# Altium project 24V-10A-Power-Board-v2.0.PrjPcb (part 14 of 17)
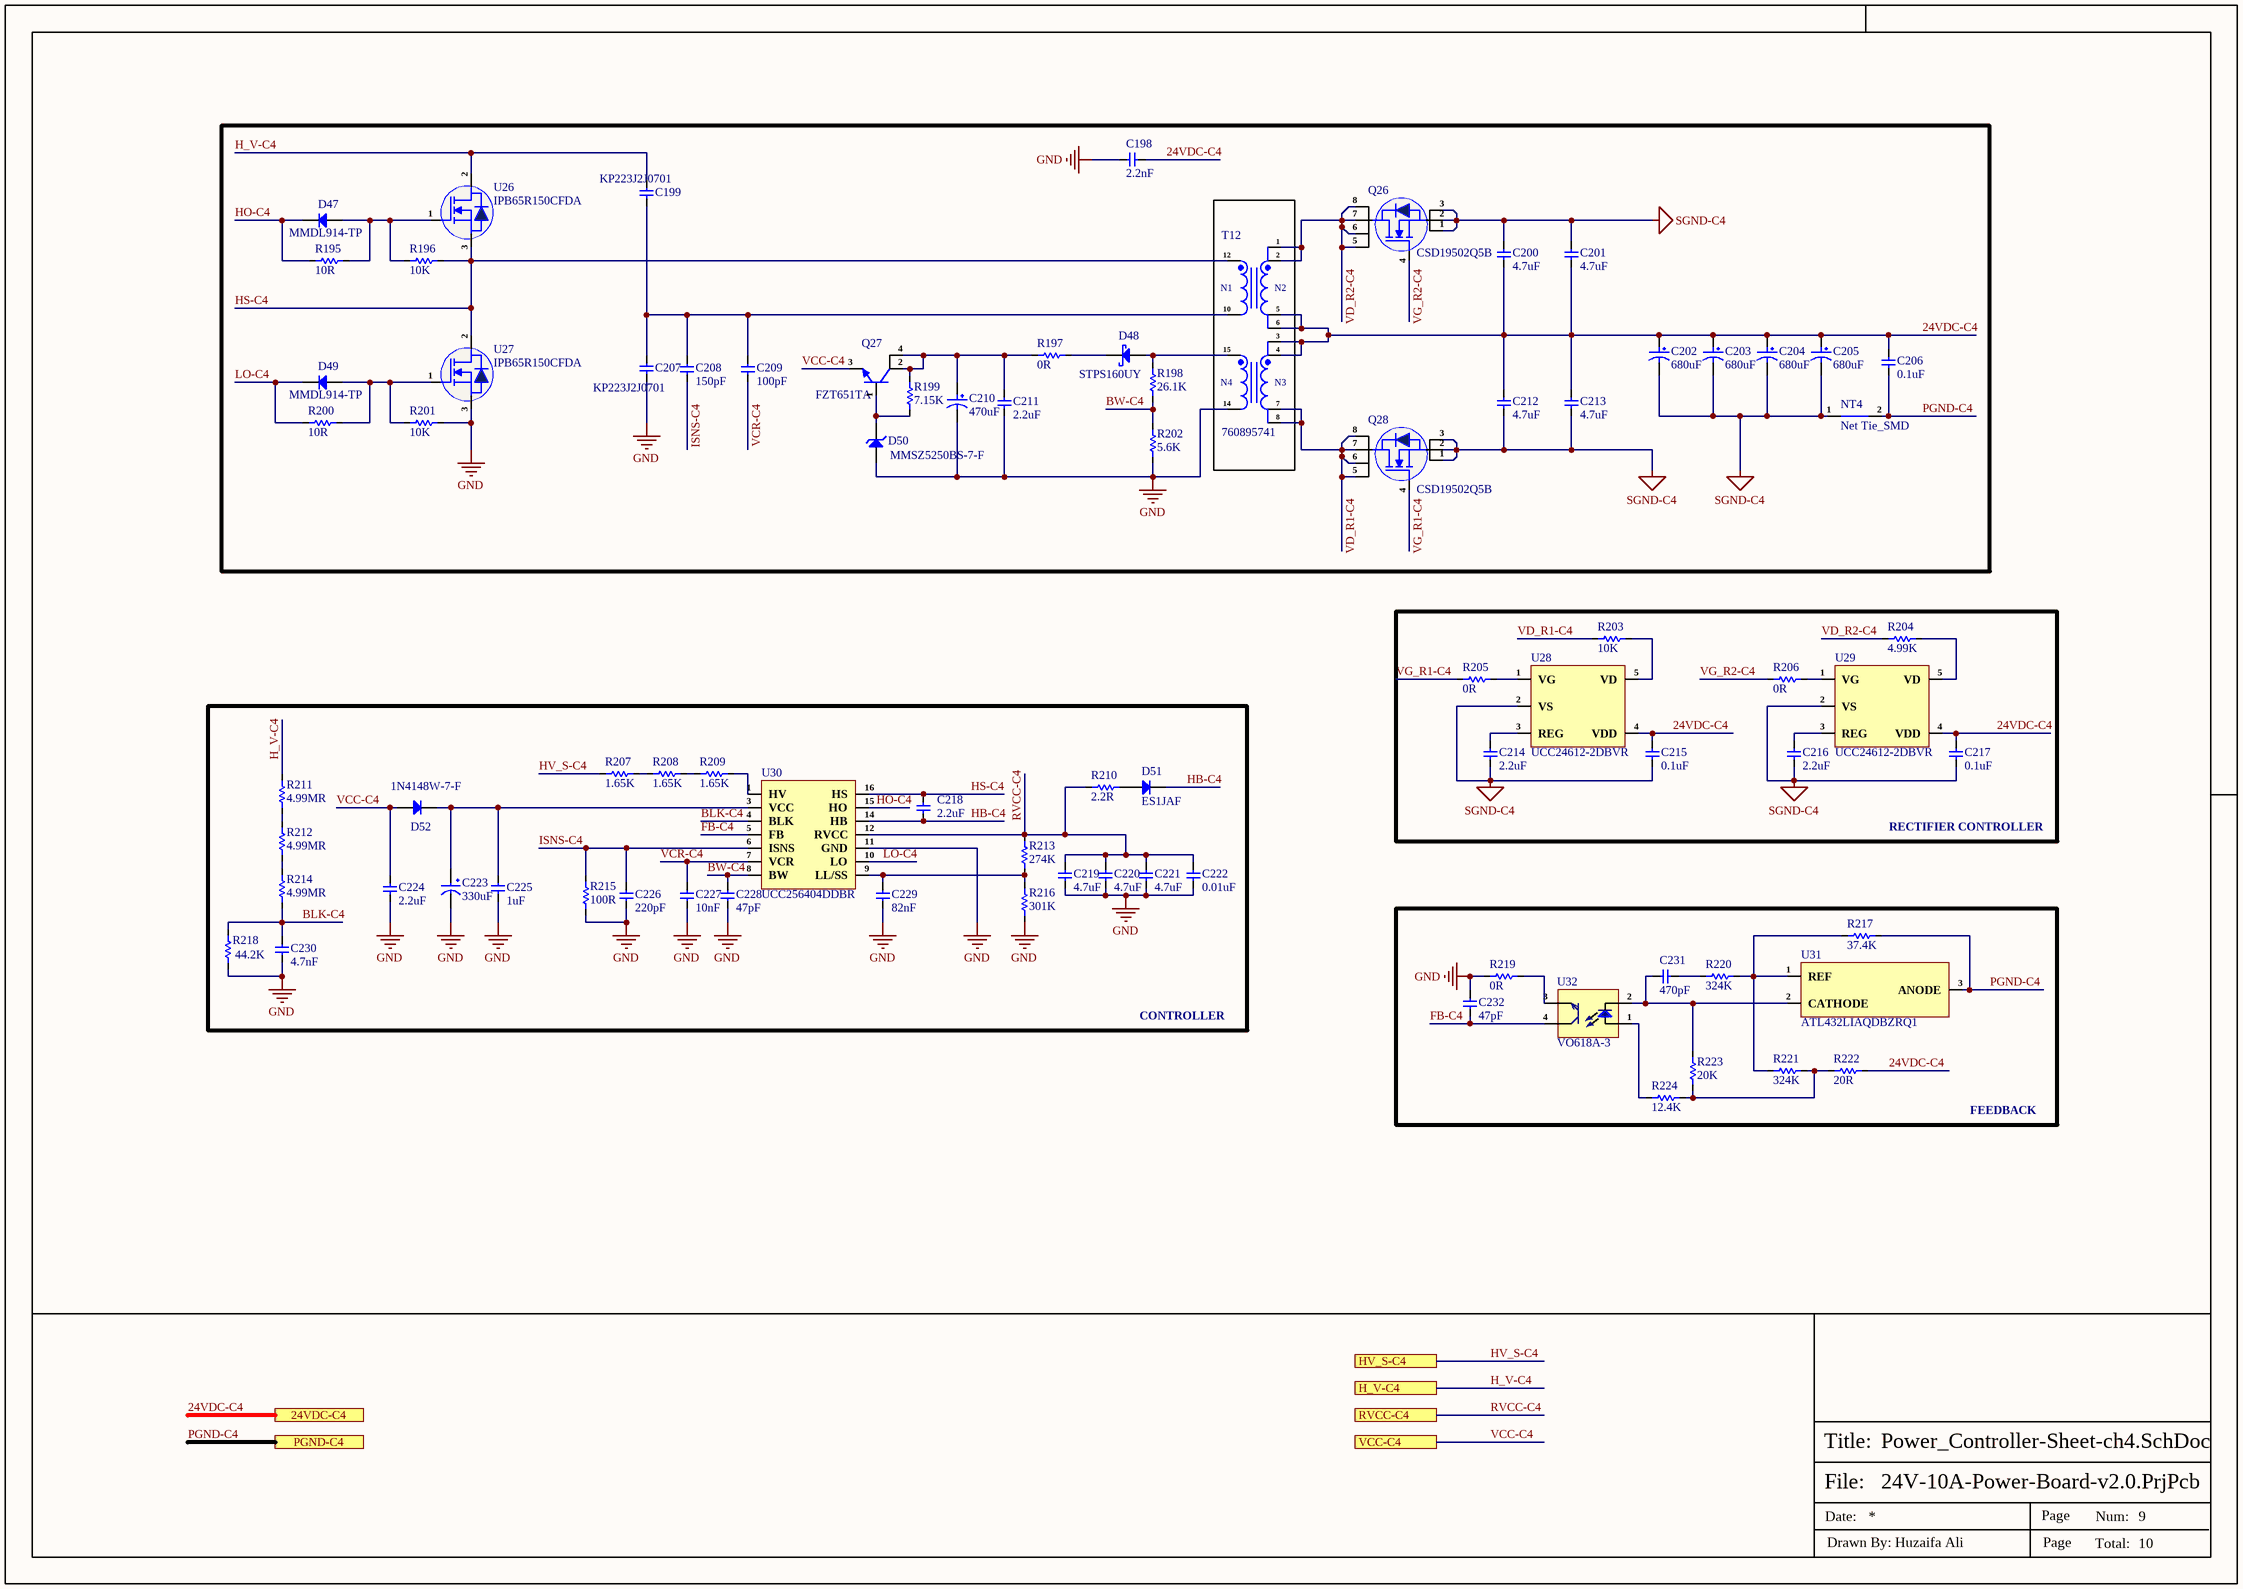
[diagram p22: Power_Controller-Sheet-ch4.SchDoc]

## Sheet Power_Controller-Sheet-ch4.SchDoc (continued)
### Library data of the parts
C198 = DE1E3RA222MA4BN01F: 2200 pF ±20% 250VAC Ceramic Capacitor E Radial, Disc; Manufacturer: Murata; Item Type: Capacitors; Supplier: Mouser; LCSC Part Number: C343981; Manufacturer Part Number: DE1E3RA222MA4BN01F; RoHS: Yes; Stock: 37677; Pricing: 1=0.42, 10=0.271, 50=0.271, 100=0.146, 1000=0.114, 10000=0.097 (USD); ComponentLink1URL: http://www.farnell.com/datasheets/2608335.pdf?src-supplier=Farnell; ComponentLink1Description: http://www.farnell.com/datasheets/2608335.pdf?src-supplier=Farnell; ComponentLink2URL: http://www.farnell.com/datasheets/2608335.pdf?src-supplier=Newark; ComponentLink2Description: http://www.farnell.com/datasheets/2608335.pdf?src-supplier=Newark; ComponentLink3URL: https://datasheet.octopart.com/DE1E3RA222MA4BN01F-Murata-datasheet-166166226.pdf?src-supplier=TME; ComponentLink3Description: https://datasheet.octopart.com/DE1E3RA222MA4BN01F-Murata-datasheet-166166226.pdf?src-supplier=TME
C199 C207 = KP223J2J0701: 22nF -40℃~+100℃ ±5% 630V Plugin,P=7.5mm Polypropylene Film Capacitors (CBB) ROHS; Manufacturer: KYET; Manufacturer Part Number: KP223J2J0701; Package: Plugin,P=7.5mm; LCSC Part Number: C390073; Item Type: Capacitor; ComponentLink1Description: LCSC; ComponentLink1URL: https://www.lcsc.com/product-detail/Polypropylene-Film-Capacitors-CBB_KYET-KP223J2J0701_C390073.html
C200 C201 C212 C213 = UMK316AB7475KL-T: CAP CER 4.7UF 50V X7R 1206; Manufacturer: Taiyo Yuden; Item Type: Capacitor; Tolerance: 10%; Supplier: Digikey; LCSC Part Number: C92853; Manufacturer Part Number: UMK316AB7475KL-T; RoHS: Yes; Stock: 392550; Pricing: 1=0.3, 10=0.198, 50=0.146, 100=0.1189, 500=0.09386, 1000=0.07925 (USD); Mounting Technology: Surface Mount; Case/Package: 1206; Pins: 2; Case Code (Metric): 3216; Case Code (Imperial): 1206; Min Operating Temperature: -55°C; Max Operating Temperature: 125°C; Value: 4.7uF; Voltage Rating: 50V; Packaging: Tape and Reel; Package Quantity: 2000; Voltage Rating (DC): 50V; Dielectric: X7R; Termination: SMD/SMT; Series: M; Construction: Flat; Length: 3.2mm; Width: 1.6mm; Height: 1.6mm; Depth: 1.6mm; Radiation Hardening: No; RoHS Compliant: Yes; Reach SVHC Compliant: Unknown; ComponentLink1URL: https://datasheet.ciiva.com/170/umk316ab7475kl-t-ss-170928.pdf?src-supplier=Digikey; ComponentLink1Description: https://datasheet.ciiva.com/170/umk316ab7475kl-t-ss-170928.pdf?src-supplier=Digikey; ComponentLink2URL: https://datasheet.ciiva.com/2990/umk316ab7475kl-t-ss-2990070.pdf?src-supplier=Avnet; ComponentLink2Description: https://datasheet.ciiva.com/2990/umk316ab7475kl-t-ss-2990070.pdf?src-supplier=Avnet; ComponentLink3URL: https://datasheet.ciiva.com/15922/1010umk316ab7475kl-t-15922628.pdf?src-supplier=Onlinecomponents.com; ComponentLink3Description: https://datasheet.ciiva.com/15922/1010umk316ab7475kl-t-15922628.pdf?src-supplier=Onlinecomponents.com; ComponentLink4URL: https://datasheet.ciiva.com/7975/1481447-7975911.pdf?src-supplier=Element14; ComponentLink4Description: https://datasheet.ciiva.com/7975/1481447-7975911.pdf?src-supplier=Element14; ComponentLink5URL: https://datasheet.ciiva.com/5413/mlcc-all-e-541559-5413006.pdf?src-supplier=Mouser; ComponentLink5Description: https://datasheet.ciiva.com/5413/mlcc-all-e-541559-5413006.pdf?src-supplier=Mouser
C202-C205 = EEU-FR1V681B: as C167-C170 on sheet Power_Controller-Sheet-ch3; Supplier: Digikey; LCSC Part Number: C178718; Manufacturer Part Number: EEU-FR1V681B; RoHS: Yes; Stock: 566; Pricing: 1=0.93, 10=0.674, 50=0.5894, 100=0.4803 (USD); Mounting Technology: Through Hole; Case/Package: Radial; Min Operating Temperature: -40°C; Max Operating Temperature: 105°C; Package Quantity: 500; Value: 680uF; Voltage Rating: 35V; Tolerance: 20%; Packaging: Tape and Reel; Voltage Rating (DC): 35V; ESR (Equivalent Series Resistance): 20mR; Termination: Radial; Series: FR; Features: General Purpose; Diameter: 10mm; Length: 20mm; Height: 20mm; Lead Pitch: 5mm; Height - Seated (Max): 0.866inch; Radiation Hardening: No; Reach SVHC Compliant: Yes; RoHS Compliant: Yes; ComponentLink1URL: https://datasheet.ciiva.com/11677/aba0000ce132-11677705.pdf?src-supplier=Avnet; ComponentLink1Description: https://datasheet.ciiva.com/11677/aba0000ce132-11677705.pdf?src-supplier=Avnet; ComponentLink2URL: https://datasheet.ciiva.com/15941/aba0000ce132-15941222.pdf?src-supplier=Onlinecomponents.com; ComponentLink2Description: https://datasheet.ciiva.com/15941/aba0000ce132-15941222.pdf?src-supplier=Onlinecomponents.com; ComponentLink3URL: https://datasheet.ciiva.com/43469/1653413-43469593.pdf?src-supplier=Farnell; ComponentLink3Description: https://datasheet.ciiva.com/43469/1653413-43469593.pdf?src-supplier=Farnell; ComponentLink4URL: https://datasheet.ciiva.com/46371/1653413-46371786.pdf?src-supplier=Element14; ComponentLink4Description: https://datasheet.ciiva.com/46371/1653413-46371786.pdf?src-supplier=Element14; ComponentLink5URL: https://datasheet.ciiva.com/29248/448590-da-01-en-alu-kondensator-fr-r-680-uf-35v-500st-29248054.pdf?src-supplier=Conrad; ComponentLink5Description: https://datasheet.ciiva.com/29248/448590-da-01-en-alu-kondensator-fr-r-680-uf-35v-500st-29248054.pdf?src-supplier=Conrad
C206 C215 C217 = CC1206KRX7R9BB104: CAP CER 0.1UF 50V X7R 1206; Manufacturer: Yageo; Item Type: Capacitor; Material: Ceramic; Value: 100nF; Tolerance: 10%; Insulation Resistance: 100GR; Supplier: Digikey; LCSC Part Number: 311-1179-1-ND; Manufacturer Part Number: CC1206KRX7R9BB104; RoHS: Yes; Stock: 520624; Pricing: 1=0.19, 10=0.128, 50=0.0764, 100=0.0601, 500=0.04436, 1000=0.03672 (USD); Mounting Technology: Surface Mount; Case/Package: 1206; Pins: 2; Case Code (Metric): 3216; Case Code (Imperial): 1206; Min Operating Temperature: -55°C; Max Operating Temperature: 125°C; Dielectric: X7R; Packaging: Tape and Reel; Voltage Rating: 50V; Termination: SMD/SMT; Voltage: 50V; Voltage Rating (DC): 50V; Series: CC; Length: 3.2mm; Height: 0.85mm; Depth: 1.6mm; Radiation Hardening: No; RoHS Compliant: Yes; Reach SVHC Compliant: Unknown; Lead Free: 5697LeadFree; Halogen Free: 5694HalogenFree; ComponentLink1URL: https://datasheet.ciiva.com/11786/0900766b80d84f1d-11786968.pdf?src-supplier=Rs; ComponentLink1Description: https://datasheet.ciiva.com/11786/0900766b80d84f1d-11786968.pdf?src-supplier=Rs; ComponentLink2URL: https://datasheet.ciiva.com/7978/1489800-7978230.pdf?src-supplier=Element14; ComponentLink2Description: https://datasheet.ciiva.com/7978/1489800-7978230.pdf?src-supplier=Element14; ComponentLink3URL: https://datasheet.ciiva.com/28450/1489800-28450892.pdf?src-supplier=Element14; ComponentLink3Description: https://datasheet.ciiva.com/28450/1489800-28450892.pdf?src-supplier=Element14; ComponentLink4URL: https://datasheet.ciiva.com/144/mlccorderingcode-144906.pdf?src-supplier=Digikey; ComponentLink4Description: https://datasheet.ciiva.com/144/mlccorderingcode-144906.pdf?src-supplier=Digikey; ComponentLink5URL: https://datasheet.ciiva.com/144/mlccorderingcode-144905.pdf?src-supplier=Digikey; ComponentLink5Description: https://datasheet.ciiva.com/144/mlccorderingcode-144905.pdf?src-supplier=Digikey; ComponentLink6URL: https://datasheet.ciiva.com/144/mlccorderingcode-144907.pdf?src-supplier=Digikey; ComponentLink6Description: https://datasheet.ciiva.com/144/mlccorderingcode-144907.pdf?src-supplier=Digikey; ComponentLink7URL: https://datasheet.ciiva.com/5425/upy-gp-np0-16v-to-50v-8-3714-5425561.pdf?src-supplier=Mouser; ComponentLink7Description: https://datasheet.ciiva.com/5425/upy-gp-np0-16v-to-50v-8-3714-5425561.pdf?src-supplier=Mouser; ComponentLink8URL: https://datasheet.ciiva.com/28363/1734573-28363672.pdf?src-supplier=Element14; ComponentLink8Description: https://datasheet.ciiva.com/28363/1734573-28363672.pdf?src-supplier=Element14; ComponentLink9URL: https://datasheet.ciiva.com/46385/1734573-46385063.pdf?src-supplier=Element14; ComponentLink9Description: https://datasheet.ciiva.com/46385/1734573-46385063.pdf?src-supplier=Element14; ComponentLink10URL: https://datasheet.ciiva.com/15189/getdatasheetpartid-251811-15189275.pdf?src-supplier=Verical; ComponentLink10Description: https://datasheet.ciiva.com/15189/getdatasheetpartid-251811-15189275.pdf?src-supplier=Verical
C208 = GRM31A5C2J151JW01D: CAP CER 150PF 630V C0G/NP0 1206; Manufacturer: Murata; Item Type: Capacitor; Supplier: Mouser; LCSC Part Number: C162445; Manufacturer Part Number: GRM31A5C2J151JW01D; RoHS: Yes; Stock: 4361; Pricing: 1=0.35, 10=0.194, 50=0.194, 100=0.12, 1000=0.1, 10000=0.08 (USD); ComponentLink1URL: https://datasheet.ciiva.com/138/partnumbering-e-01-138796.pdf?src-supplier=Digikey; ComponentLink1Description: https://datasheet.ciiva.com/138/partnumbering-e-01-138796.pdf?src-supplier=Digikey; ComponentLink2URL: https://datasheet.ciiva.com/138/partnumbering-e-01-138797.pdf?src-supplier=Digikey; ComponentLink2Description: https://datasheet.ciiva.com/138/partnumbering-e-01-138797.pdf?src-supplier=Digikey; ComponentLink3URL: https://datasheet.ciiva.com/138/partnumbering-e-01-138798.pdf?src-supplier=Digikey; ComponentLink3Description: https://datasheet.ciiva.com/138/partnumbering-e-01-138798.pdf?src-supplier=Digikey; ComponentLink4URL: https://datasheet.ciiva.com/13240/c02e-2905-13240518.pdf?src-supplier=Mouser; ComponentLink4Description: https://datasheet.ciiva.com/13240/c02e-2905-13240518.pdf?src-supplier=Mouser
C209 = GRM31A5C3A101JW01D: CAP CER 100PF 1KV 5% NP0 1206; Manufacturer: Murata; Item Type: Capacitor; Supplier: Future Electronics; LCSC Part Number: C162451; Manufacturer Part Number: GRM31A5C3A101JW01D; RoHS: Yes; Stock: 4000; Pricing: 4000=0.0742, 8000=0.0723, 12000=0.0712, 16000=0.0704, 20000=0.068 (USD); ComponentLink1URL: https://datasheet.ciiva.com/29535/partnumbering-e-01-29535608.pdf?src-supplier=Digikey; ComponentLink1Description: https://datasheet.ciiva.com/29535/partnumbering-e-01-29535608.pdf?src-supplier=Digikey; ComponentLink2URL: https://datasheet.ciiva.com/7829/1666664-7829029.pdf?src-supplier=Element14; ComponentLink2Description: https://datasheet.ciiva.com/7829/1666664-7829029.pdf?src-supplier=Element14
C210 = EEU-FR1V471B: CAP ALUM 470UF 20% 35V RADIAL; Manufacturer: Panasonic; Item Type: Capacitor; Leakage Current: 164.5uA; Supplier: Mouser; LCSC Part Number: C713403; Manufacturer Part Number: EEU-FR1V471B; RoHS: Yes; Stock: 21799; Pricing: 1=0.78, 10=0.461, 50=0.461, 100=0.375, 1000=0.263, 10000=0.23 (USD); Pins: 2NUMBER; Lead Free: 5697LeadFree; ComponentLink1URL: https://datasheet.ciiva.com/43469/1653413-43469590.pdf?src-supplier=Farnell; ComponentLink1Description: https://datasheet.ciiva.com/43469/1653413-43469590.pdf?src-supplier=Farnell; ComponentLink2URL: https://datasheet.ciiva.com/11678/aba0000ce132-11678063.pdf?src-supplier=Avnet; ComponentLink2Description: https://datasheet.ciiva.com/11678/aba0000ce132-11678063.pdf?src-supplier=Avnet; ComponentLink3URL: https://datasheet.ciiva.com/46371/1653413-46371772.pdf?src-supplier=Element14; ComponentLink3Description: https://datasheet.ciiva.com/46371/1653413-46371772.pdf?src-supplier=Element14; ComponentLink4URL: https://datasheet.ciiva.com/7805/1725490-7805503.pdf?src-supplier=Element14; ComponentLink4Description: https://datasheet.ciiva.com/7805/1725490-7805503.pdf?src-supplier=Element14; ComponentLink5URL: https://datasheet.ciiva.com/30252/9aba0000ce132-30252342.pdf?src-supplier=Onlinecomponents.com; ComponentLink5Description: https://datasheet.ciiva.com/30252/9aba0000ce132-30252342.pdf?src-supplier=Onlinecomponents.com; ComponentLink6URL: https://datasheet.ciiva.com/16387/aba0000ce132-16387061.pdf?src-supplier=Future+Electronics; ComponentLink6Description: https://datasheet.ciiva.com/16387/aba0000ce132-16387061.pdf?src-supplier=Future+Electronics; ComponentLink7URL: https://datasheet.ciiva.com/14602/70257620-14602201.pdf?src-supplier=Allied+Electronics; ComponentLink7Description: https://datasheet.ciiva.com/14602/70257620-14602201.pdf?src-supplier=Allied+Electronics; ComponentLink8URL: https://datasheet.ciiva.com/29247/448536-da-01-en-alu-kondensator-fr-r-470-uf-35v-500st-29247995.pdf?src-supplier=Conrad; ComponentLink8Description: https://datasheet.ciiva.com/29247/448536-da-01-en-alu-kondensator-fr-r-470-uf-35v-500st-29247995.pdf?src-supplier=Conrad
C211 = CC1206KKX5R9BB225: CAP CER 2.2UF 50V X5R 1206; Manufacturer: Yageo; Item Type: Capacitor; Material: 4241ConductorMaterial; Tolerance: 10%; Supplier: Digikey; LCSC Part Number: C577210; Manufacturer Part Number: CC1206KKX5R9BB225; RoHS: Yes; Stock: 4588; Pricing: 1=0.59, 10=0.395, 50=0.3144, 100=0.2597, 500=0.20286, 1000=0.17244 (USD); Mounting Technology: Surface Mount; Case/Package: 1206; Case Code (Metric): 3216; Case Code (Imperial): 1206; Weight: 0.000571oz; Min Operating Temperature: -55°C; Max Operating Temperature: 85°C; Packaging: Tape and Reel; Value: 2.2uF; Voltage Rating: 50V; Dielectric: X5R; Termination: SMD/SMT; Voltage Rating (DC): 50V; Package Quantity: 2000; Series: CC; Length: 0.126inch; Width: 0.063inch; Height: 1.45mm; Thickness: 0.071inch; Lead Free: Lead Free; Halogen Free: Halogen Free; RoHS Compliant: Yes; ComponentLink1URL: http://www.mouser.com/ds/2/447/Yageo_UPY-GP_NP0_16V-to-50V_9-358835.pdf?src-supplier=Mouser; ComponentLink1Description: http://www.mouser.com/ds/2/447/Yageo_UPY-GP_NP0_16V-to-50V_9-358835.pdf?src-supplier=Mouser; ComponentLink2URL: http://www.yageo.com/documents/recent/UPY-GPHC_X5R_4V-to-50V_25.pdf?src-supplier=Digikey; ComponentLink2Description: http://www.yageo.com/documents/recent/UPY-GPHC_X5R_4V-to-50V_25.pdf?src-supplier=Digikey
C214 C216 = CC0603KRX5R8BB225: CAP CER 2.2UF 25V X5R 0603; Manufacturer: Yageo; Tolerance: 10%; Item Type: Capacitor; Supplier 1: Digi-Key; Manufacturer Part Number: CC0603KRX5R8BB225; Stock 1: 687936; Pricing 1: 1=0.4, 10=0.276, 50=0.1932, 100=0.1656, 500=0.1242, 1000=0.10488 (USD); Mount: Surface Mount; Case/Package: 0603; Case Code (Metric): 1608; Case Code (Imperial): 0603; Weight: 7.1E-05oz; Min Operating Temperature: -55°C; Max Operating Temperature: 85°C; Packaging: Tape and Reel; Capacitance: 2.2uF; Dielectric: X5R; Voltage Rating: 25V; Termination: SMD/SMT; Resistor Type: Ceramic; Voltage Rating (DC): 25V; Package Quantity: 4000; Length: 1.6mm; Width: 0.031inch; Thickness: 0.037inch; Depth: 0.8mm; Radiation Hardening: No; Lead Free: Lead Free; Halogen Free: Halogen Free; RoHS Compliant: Yes; ComponentLink1URL: https://www.verical.com/server-webapp/html/getDatasheet?partID=782757&src-supplier=Verical; ComponentLink1Description: https://www.verical.com/server-webapp/html/getDatasheet?partID=782757&src-supplier=Verical; Supplier Part Number 1: 311-1786-1-ND; LCSC Part Number: C309478
C218 = CC1206KKX7R7BB225: CAP CER 2.2UF 16V X7R 1206; Manufacturer: Yageo; Item Type: Capacitors; Material: 4241ConductorMaterial; Supplier: Digikey; LCSC Part Number: C107183; Manufacturer Part Number: CC1206KKX7R7BB225; RoHS: Yes; Stock: 202610; Pricing: 1=0.22, 10=0.144, 50=0.1012, 100=0.0817, 500=0.06072, 1000=0.05312 (USD); ComponentLink1URL: https://datasheet.ciiva.com/11788/0900766b80d84f1d-11788402.pdf?src-supplier=Rs; ComponentLink1Description: https://datasheet.ciiva.com/11788/0900766b80d84f1d-11788402.pdf?src-supplier=Rs; ComponentLink2URL: https://datasheet.ciiva.com/11466/upy-gphc-x7r-6-3v-to-50v-8-11466572.pdf?src-supplier=Avnet; ComponentLink2Description: https://datasheet.ciiva.com/11466/upy-gphc-x7r-6-3v-to-50v-8-11466572.pdf?src-supplier=Avnet; ComponentLink3URL: https://datasheet.ciiva.com/5425/upy-gphc-x7r-6-3v-to-50v-8-12304-5425499.pdf?src-supplier=Mouser; ComponentLink3Description: https://datasheet.ciiva.com/5425/upy-gphc-x7r-6-3v-to-50v-8-12304-5425499.pdf?src-supplier=Mouser
C219-C221 = CC0603KRX5R7BB475: as C184-C186 on sheet Power_Controller-Sheet-ch3; Supplier 1: Digi-Key; Manufacturer Part Number: CC0603KRX5R7BB475; RoHS: Yes; Category: Ceramic Capacitors; Stock 1: 547703; Pricing 1: 1=0.20000, 10=0.13800, 50=0.08280, 100=0.06990, 500=0.04784, 1000=0.04233 (USD); Mount: Surface Mount; Case/Package: 0603; Case Code (Imperial): 0603; Case Code (Metric): 1608; Weight: 7.1E-05oz; Min Operating Temperature: -55°C; Max Operating Temperature: 85°C; Capacitance: 4.7uF; Voltage Rating: 16V; Voltage Rating (DC): 16V; Packaging: Tape and Reel; Dielectric: X5R; Termination: SMD/SMT; Resistor Type: Ceramic; Series: CC; Length: 1.6mm; Width: 0.8mm; Height: 0.8mm; Thickness: 0.037inch; Depth: 0.8mm; Lead Free: Lead Free; Halogen Free: Halogen Free; RoHS Compliant: Yes; ComponentLink1URL: http://www.mouser.com/ds/2/447/UPY-GPHC_X5R_4V-to-50V_25-1131599.pdf?src-supplier=Mouser; ComponentLink1Description: http://www.mouser.com/ds/2/447/UPY-GPHC_X5R_4V-to-50V_25-1131599.pdf?src-supplier=Mouser; ComponentLink2URL: http://www.yageo.com/documents/recent/UPY-GPHC_X5R_4V-to-50V_25.pdf?src-supplier=Digi-Key; ComponentLink2Description: http://www.yageo.com/documents/recent/UPY-GPHC_X5R_4V-to-50V_25.pdf?src-supplier=Digi-Key; Supplier Part Number 1: 311-1785-1-ND; LCSC Part Number: C277476
C222 = GRM1885C1H103JA01D: CAP CER 10000PF 50V C0G/NP0 0603; Manufacturer: Murata; Material: Ceramic; Capacitance: 10nF; Tolerance: 5%; Dielectric: C0G; Supplier 1: RSComponents; Manufacturer Part Number: GRM1885C1H103JA01D; RoHS: Yes; Category: Ceramic Capacitors; Stock 1: 80000; Pricing 1: 4000=0.03500, 8000=0.03200 (GBP); Mount: Surface Mount; Case/Package: 0603; Case Code (Metric): 1608; Case Code (Imperial): 0603; Min Operating Temperature: -55°C; Max Operating Temperature: 125°C; Packaging: Tape and Reel; Package Quantity: 4000; Voltage Rating: 50V; Voltage Rating (DC): 50V; Termination: SMD/SMT; Voltage: 50V; Series: GRM; Length: 1.6mm; Width: 0.8mm; Height: 0.8mm; Thickness: 0.035inch; Lead Pitch: 0.5mm; Depth: 0.8mm; REACH SVHC: No SVHC; Lead Free: Lead Free; RoHS Compliant: Yes; ComponentLink1URL: https://datasheet.ciiva.com/41860/partnumbering-e-01-41860759.pdf?src-supplier=Digi-Key; ComponentLink1Description: https://datasheet.ciiva.com/41860/partnumbering-e-01-41860759.pdf?src-supplier=Digi-Key; ComponentLink2URL: https://datasheet.ciiva.com/29537/partnumbering-e-01-29537910.pdf?src-supplier=Digi-Key; ComponentLink2Description: https://datasheet.ciiva.com/29537/partnumbering-e-01-29537910.pdf?src-supplier=Digi-Key; Supplier Part Number 1: 1449032
C223 = RC035M331LO8*14TH-2A1E: 330uF 35V ±20% 860mA@100kHz Plugin,D8xL14mm Aluminum Electrolytic Capacitors - Leaded ROHS; Manufacturer: BERYL Electronic Tech; Manufacturer Part Number: RC035M331LO8*14TH-2A1E; Package: Plugin,D8xL14mm; LCSC Part Number: C357626; Item Type: Capacitor; ComponentLink1Description: LCSC; ComponentLink1URL: https://www.lcsc.com/product-detail/Aluminum-Electrolytic-Capacitors-Leaded_BERYL-Electronic-Tech-RC035M331LO8-14TH-2A1E_C357626.html
C224 = GRM188R6YA225KA12D: CAP, 2.2µF, 35V, 10%, X5R, 0603; Manufacturer: Murata; Material: Ceramic; Item Type: Capacitor; Supplier 1: Digi-Key; Manufacturer Part Number: GRM188R6YA225KA12D; RoHS: Yes; Category: Ceramic Capacitors; Stock 1: 81665; Pricing 1: 1=0.21000, 10=0.14100, 50=0.08480, 100=0.07170, 500=0.04904, 1000=0.04338 (USD); Mount: Surface Mount; Case/Package: 0603; Case Code (Metric): 1608; Case Code (Imperial): 0603; Weight: 0.000222oz; Min Operating Temperature: -55°C; Max Operating Temperature: 85°C; Package Quantity: 4000; Packaging: Tape and Reel; Capacitance: 2.2uF; Tolerance: 10%; Voltage Rating: 35V; Dielectric: X5R; Voltage: 35V; Termination: SMD/SMT; Voltage Rating (DC): 35V; Series: GRM; Length: 1.6mm; Width: 0.8mm; Height: 0.8mm; Thickness: 0.035inch; Depth: 0.8mm; REACH SVHC: No SVHC; Lead Free: Lead Free; RoHS Compliant: Yes; ComponentLink1URL: https://datasheet.ciiva.com/14906/partnumbering-e-01-14906490.pdf?src-supplier=Digi-Key; ComponentLink1Description: https://datasheet.ciiva.com/14906/partnumbering-e-01-14906490.pdf?src-supplier=Digi-Key; ComponentLink2URL: https://datasheet.ciiva.com/14906/partnumbering-e-01-14906491.pdf?src-supplier=Digi-Key; ComponentLink2Description: https://datasheet.ciiva.com/14906/partnumbering-e-01-14906491.pdf?src-supplier=Digi-Key; ComponentLink3URL: https://datasheet.ciiva.com/14906/partnumbering-e-01-14906492.pdf?src-supplier=Digi-Key; ComponentLink3Description: https://datasheet.ciiva.com/14906/partnumbering-e-01-14906492.pdf?src-supplier=Digi-Key; Supplier Part Number 1: 490-7204-1-ND; LCSC Part Number: C86017
C225 = GRM31CR72A105KA01K: CAP CER 1UF 100V X7R 1206; Manufacturer: Murata; Tolerance: 10%; Supplier 1: Digi-Key; Manufacturer Part Number: GRM31CR72A105KA01K; RoHS: Yes; Category: Ceramic Capacitors; Stock 1: 11842; Pricing 1: 1=0.48000, 10=0.33000, 50=0.23100, 100=0.19800, 500=0.14850, 1000=0.12540, 2500=0.11880 (USD); Mount: Surface Mount; Case/Package: 1206; Case Code (Imperial): 1206; Case Code (Metric): 3216; Min Operating Temperature: -55°C; Max Operating Temperature: 125°C; Capacitance: 1uF; Voltage Rating: 100V; Voltage Rating (DC): 100V; Packaging: Tape and Reel; Package Quantity: 1; Dielectric: X7R; Termination: SMD/SMT; Series: GRM; Construction: Flat; Length: 3.2mm; Width: 1.6mm; Height: 1.6mm; Thickness: 0.071inch; Depth: 1.6mm; Radiation Hardening: No; RoHS Compliant: Yes; ComponentLink1URL: https://datasheet.ciiva.com/11616/product-11616604.pdf?src-supplier=Avnet; ComponentLink1Description: https://datasheet.ciiva.com/11616/product-11616604.pdf?src-supplier=Avnet; ComponentLink2URL: https://datasheet.ciiva.com/6264/partnumbering-e-01-6264397.pdf?src-supplier=Digi-Key; ComponentLink2Description: https://datasheet.ciiva.com/6264/partnumbering-e-01-6264397.pdf?src-supplier=Digi-Key; ComponentLink3URL: https://datasheet.ciiva.com/6264/partnumbering-e-01-6264398.pdf?src-supplier=Digi-Key; ComponentLink3Description: https://datasheet.ciiva.com/6264/partnumbering-e-01-6264398.pdf?src-supplier=Digi-Key; ComponentLink4URL: https://datasheet.ciiva.com/6264/partnumbering-e-01-6264399.pdf?src-supplier=Digi-Key; ComponentLink4Description: https://datasheet.ciiva.com/6264/partnumbering-e-01-6264399.pdf?src-supplier=Digi-Key; Supplier Part Number 1: 490-6523-1-ND; LCSC Part Number: C909823
C226 = CS1608X7R221K500NRB: 50V 220pF X7R ±10% 0603 Multilayer Ceramic Capacitors MLCC - SMD/SMT ROHS; Manufacturer: Samwha Capacitors; Manufacturer Part Number: CS1608X7R221K500NRB; Package: 0603; LCSC Part Number: C5255295; Item Type: Capacitor; ComponentLink1Description: LCSC; ComponentLink1URL: https://www.lcsc.com/product-detail/Multilayer-Ceramic-Capacitors-MLCC-SMD-SMT_Samwha-Capacitor-CS1608X7R221K500NRB_C5255295.html
C227 = 06031C103KAT2A: CAP CER 10000PF 100V X7R 0603; Manufacturer: Kyocera AVX; Item Type: Capacitors; Material: 4241ConductorMaterial; Tolerance: 10%; Insulation Resistance: 100GR; Dissipation Factor: 2.5%; Supplier: Avnet; LCSC Part Number: C2167322; Manufacturer Part Number: 06031C103KAT2A; RoHS: Yes; Stock: 512000; Pricing: 4000=0.05033 (USD); Mounting Technology: Surface Mount,PCB; Case/Package: 0603; Pins: 2; Case Code (Metric): 1608; Case Code (Imperial): 0603; Min Operating Temperature: -55°C; Max Operating Temperature: 125°C; Value: 10nF; Dielectric: X7R; Packaging: Tape and Reel; Voltage Rating (DC): 100V; Voltage: 100V; Voltage Rating: 100V; Package Quantity: 4000; Termination: SMD/SMT; Series: -; Construction: Flat; Voltage Rating (AC): 100V; Length: 1.6mm; Width: 0.006inch; Height: 0.9mm; Depth: 0.81mm; Thickness: 0.034inch; Reach SVHC Compliant: No; Lead Free: Lead Free; RoHS Compliant: Yes; ComponentLink1URL: https://datasheet.ciiva.com/11788/0900766b80dc2409-11788544.pdf?src-supplier=Rs; ComponentLink1Description: https://datasheet.ciiva.com/11788/0900766b80dc2409-11788544.pdf?src-supplier=Rs; ComponentLink2URL: https://datasheet.ciiva.com/1124/1679506-1124248.pdf?src-supplier=Element14; ComponentLink2Description: https://datasheet.ciiva.com/1124/1679506-1124248.pdf?src-supplier=Element14; ComponentLink3URL: https://datasheet.ciiva.com/152/cx7r-152476.pdf?src-supplier=Digikey; ComponentLink3Description: https://datasheet.ciiva.com/152/cx7r-152476.pdf?src-supplier=Digikey; ComponentLink4URL: https://datasheet.ciiva.com/2987/cx7r-2987736.pdf?src-supplier=Avnet; ComponentLink4Description: https://datasheet.ciiva.com/2987/cx7r-2987736.pdf?src-supplier=Avnet; ComponentLink5URL: https://datasheet.ciiva.com/1124/1679506-1124247.pdf?src-supplier=Element14; ComponentLink5Description: https://datasheet.ciiva.com/1124/1679506-1124247.pdf?src-supplier=Element14; ComponentLink6URL: https://datasheet.ciiva.com/7855/1679506-7855035.pdf?src-supplier=Element14; ComponentLink6Description: https://datasheet.ciiva.com/7855/1679506-7855035.pdf?src-supplier=Element14; ComponentLink7URL: https://datasheet.ciiva.com/152/cx7r-152475.pdf?src-supplier=Digikey; ComponentLink7Description: https://datasheet.ciiva.com/152/cx7r-152475.pdf?src-supplier=Digikey; ComponentLink8URL: https://datasheet.ciiva.com/152/cx7r-152477.pdf?src-supplier=Digikey; ComponentLink8Description: https://datasheet.ciiva.com/152/cx7r-152477.pdf?src-supplier=Digikey; ComponentLink9URL: https://datasheet.ciiva.com/5411/cx7r-5411278.pdf?src-supplier=Mouser; ComponentLink9Description: https://datasheet.ciiva.com/5411/cx7r-5411278.pdf?src-supplier=Mouser; ComponentLink10URL: https://datasheet.ciiva.com/14590/70001075-14590198.pdf?src-supplier=Allied+Electronics; ComponentLink10Description: https://datasheet.ciiva.com/14590/70001075-14590198.pdf?src-supplier=Allied+Electronics
C228 = GCM1555C1H470FA16D: CAP CER 47PF 50V C0G/NP0 0402; Manufacturer: Murata; Tolerance: 1%; Supplier 1: Digi-Key; Manufacturer Part Number: GCM1555C1H470FA16D; RoHS: No; Category: Ceramic Capacitors; Stock 1: 27098; Pricing 1: 1=0.11000, 10=0.07900, 50=0.04500, 100=0.03730, 500=0.02618, 1000=0.02168, 2500=0.02018, 5000=0.01846 (USD); Mount: Surface Mount; Case/Package: 0402; Case Code (Imperial): 0402; Case Code (Metric): 1005; Min Operating Temperature: -55°C; Max Operating Temperature: 125°C; Packaging: Tape and Reel; Capacitance: 47pF; Voltage Rating: 50V; Ratings: AEC-Q200; ComponentLink1URL: http://search.murata.co.jp/Ceramy/image/img/A01X/G101/ENG/GCM1555C1H470FA16-01.pdf?src-supplier=Digi-Key; ComponentLink1Description: http://search.murata.co.jp/Ceramy/image/img/A01X/G101/ENG/GCM1555C1H470FA16-01.pdf?src-supplier=Digi-Key; Supplier Part Number 1: 490-16445-1-ND; LCSC Part Number: C393684
C229 = CC0603KRX7R9BB823: CAP CER 0.082UF 50V X7R 0603; Manufacturer: Yageo; Tolerance: 10%; Supplier 1: Newark; Manufacturer Part Number: CC0603KRX7R9BB823; RoHS: Yes; Category: Ceramic Capacitors; Stock 1: 40000; Pricing 1: 1=0.01500, 4000=0.01400, 8000=0.01400 (USD); Mount: Surface Mount; Case/Package: 0603; Case Code (Imperial): 0603; Case Code (Metric): 1608; Weight: 7.1E-05oz; Min Operating Temperature: -55°C; Max Operating Temperature: 125°C; Packaging: Tape and Reel; Capacitance: 82nF; Voltage Rating (DC): 50V; Dielectric: X7R; Voltage Rating: 50V; Termination: SMD/SMT; Resistor Type: Ceramic; Series: CC; Length: 1.6mm; Width: 0.031inch; Thickness: 0.035inch; Depth: 0.8mm; Radiation Hardening: No; Lead Free: Lead Free; Halogen Free: Halogen Free; RoHS Compliant: Yes; ComponentLink1URL: https://datasheet.ciiva.com/13264/upy-gphc-x7r-6-3v-to-50v-8-12304-13264057.pdf?src-supplier=Mouser; ComponentLink1Description: https://datasheet.ciiva.com/13264/upy-gphc-x7r-6-3v-to-50v-8-12304-13264057.pdf?src-supplier=Mouser; Supplier Part Number 1: 69AH7269; LCSC Part Number: C107100
C230 = CC0603KRX7R0BB472: CAP CER 4700PF 100V X7R 0603; Manufacturer: Yageo; Item Type: Capacitor; Dielectric Material: 4241ConductorMaterial; Supplier: Digikey; LCSC Part Number: C115052; Manufacturer Part Number: CC0603KRX7R0BB472; RoHS: Yes; Stock: 67499; Pricing: 1=0.1, 10=0.05, 50=0.0288, 100=0.0223, 500=0.0168, 1000=0.01319 (USD); Voltage Rating (AC): 100V; Lead Free: 5697LeadFree; ComponentLink1URL: https://datasheet.ciiva.com/8033/1669968-8033781.pdf?src-supplier=Element14; ComponentLink1Description: https://datasheet.ciiva.com/8033/1669968-8033781.pdf?src-supplier=Element14
C231 = CC0603KPX7R9BB471: CAP CER 470PF 50V X7R 0603; Manufacturer: Yageo; Tolerance: 10%; Supplier 1: Digi-Key; Manufacturer Part Number: CC0603KPX7R9BB471; RoHS: Yes; Category: Ceramic Capacitors; Stock 1: 29788; Pricing 1: 1=0.10000, 10=0.04700, 50=0.02560, 100=0.02100, 500=0.01498, 1000=0.01176, 2500=0.01070, 5000=0.00984 (USD); Mount: Surface Mount; Case/Package: 0603; Case Code (Imperial): 0603; Case Code (Metric): 1608; Weight: 7.1E-05oz; Min Operating Temperature: -55°C; Max Operating Temperature: 125°C; Capacitance: 470pF; Dielectric: X7R; Voltage Rating (DC): 50V; Packaging: Tape and Reel; Termination: SMD/SMT; Resistor Type: Ceramic; Construction: Flat; Length: 1.6mm; Height: 0.8mm; Depth: 0.8mm; Radiation Hardening: No; Lead Free: Lead Free; Halogen Free: Halogen Free; RoHS Compliant: Yes; ComponentLink1URL: https://datasheet.ciiva.com/17436/upy-gphc-x7r-6-3v-to-50v-8-17436926.pdf?src-supplier=Avnet+Europe; ComponentLink1Description: https://datasheet.ciiva.com/17436/upy-gphc-x7r-6-3v-to-50v-8-17436926.pdf?src-supplier=Avnet+Europe; Supplier Part Number 1: 13-CC0603KPX7R9BB471CT-ND; LCSC Part Number: C2184946
C232 = CC0603FRNPO9BN470: CAP CER 47PF 50V NPO 0603; Manufacturer: Yageo; Item Type: Capacitor; Supplier: Digikey; LCSC Part Number: C519486; Manufacturer Part Number: CC0603FRNPO9BN470; RoHS: Yes; Stock: 37282; Pricing: 1=0.19, 10=0.126, 50=0.0756, 100=0.0594, 500=0.0439, 1000=0.03634 (USD); ComponentLink1URL: https://datasheet.ciiva.com/5425/upy-gp-np0-16v-to-50v-8-5425545.pdf?src-supplier=Mouser; ComponentLink1Description: https://datasheet.ciiva.com/5425/upy-gp-np0-16v-to-50v-8-5425545.pdf?src-supplier=Mouser; ComponentLink2URL: https://datasheet.ciiva.com/11586/upy-gp-np0-16v-to-50v-8-11586472.pdf?src-supplier=Avnet; ComponentLink2Description: https://datasheet.ciiva.com/11586/upy-gp-np0-16v-to-50v-8-11586472.pdf?src-supplier=Avnet
D47 D49 = MMDL914-TP: 100V 1V@10mA 4ns 200mA SOD-323 Switching Diodes ROHS; Manufacturer: MCC; Item Type: Diode; Supplier: Digikey; LCSC Part Number: C668970; Manufacturer Part Number: MMDL914-TP; RoHS: Yes; Stock: 172971; Pricing: 1=0.15, 10=0.108, 100=0.0585, 500=0.04594, 1000=0.03191 (USD); ComponentLink1URL: https://datasheet.ciiva.com/6367/mmdl914sod-323-6367364.pdf?src-supplier=Digikey; ComponentLink1Description: https://datasheet.ciiva.com/6367/mmdl914sod-323-6367364.pdf?src-supplier=Digikey; ComponentLink2URL: https://datasheet.ciiva.com/24097/mmdl914sod-323-24097719.pdf?src-supplier=Mouser; ComponentLink2Description: https://datasheet.ciiva.com/24097/mmdl914sod-323-24097719.pdf?src-supplier=Mouser; ComponentLink3URL: https://datasheet.ciiva.com/6367/mmdl914sod-323-6367366.pdf?src-supplier=Digikey; ComponentLink3Description: https://datasheet.ciiva.com/6367/mmdl914sod-323-6367366.pdf?src-supplier=Digikey; ComponentLink4URL: https://datasheet.ciiva.com/6367/mmdl914sod-323-6367368.pdf?src-supplier=Digikey; ComponentLink4Description: https://datasheet.ciiva.com/6367/mmdl914sod-323-6367368.pdf?src-supplier=Digikey
D48 = STPS160UY: DIODE SCHOTTKY 60V 1A SMB; Manufacturer: STMicroelectronics; Supplier: Mouser; LCSC Part Number: C5268303; Manufacturer Part Number: STPS160UY; RoHS: Yes; Item Type: Diode; Stock: 2181; Pricing: 1=0.46, 10=0.458, 50=0.458, 100=0.458, 1000=0.314, 10000=0.107 (USD); Mounting Technology: Surface Mount; Case/Package: SMB; Packaging: Tape and Reel; Package Quantity: 1; Average Rectified Current: 1A; Max Reverse Voltage (DC): 60V; Series: -; RoHS Compliant: Yes; ComponentLink1URL: https://datasheet.ciiva.com/6380/dm00058656-6380741.pdf?src-supplier=Digikey; ComponentLink1Description: https://datasheet.ciiva.com/6380/dm00058656-6380741.pdf?src-supplier=Digikey
D50 = MMSZ5250BS-7-F: 19V~21V 200mW 20V SOD-323-2 Zener Diodes ROHS; Item Type: Diode; Supplier: Future Electronics; LCSC Part Number: C508233; Manufacturer: Diodes; Manufacturer Part Number: MMSZ5250BS-7-F; RoHS: Yes; Stock: 3000; Pricing: 3000=0.0292, 9000=0.0281, 15000=0.0276, 60000=0.0263, 90000=0.0255 (USD); ComponentLink1URL: https://datasheet.ciiva.com/896/ds31038-896169.pdf?src-supplier=Digikey; ComponentLink1Description: https://datasheet.ciiva.com/896/ds31038-896169.pdf?src-supplier=Digikey; ComponentLink2URL: https://datasheet.ciiva.com/896/ds31038-896170.pdf?src-supplier=Digikey; ComponentLink2Description: https://datasheet.ciiva.com/896/ds31038-896170.pdf?src-supplier=Digikey; ComponentLink3URL: https://datasheet.ciiva.com/896/ds31038-896171.pdf?src-supplier=Digikey; ComponentLink3Description: https://datasheet.ciiva.com/896/ds31038-896171.pdf?src-supplier=Digikey; ComponentLink4URL: https://datasheet.ciiva.com/10640/ds31038-10640197.pdf?src-supplier=Avnet; ComponentLink4Description: https://datasheet.ciiva.com/10640/ds31038-10640197.pdf?src-supplier=Avnet
D51 = ES1JAF: DIODE GEN PURP 600V 1A DO214AD; Manufacturer: ON Semiconductor / Fairchild; Value: 15pF; Max Reverse Current: 1uA; Supplier: Digikey; LCSC Part Number: C896698; Manufacturer Part Number: ES1JAF; RoHS: Yes; Item Type: Diode; Stock: 35994; Pricing: 1=0.66, 10=0.443, 100=0.3026, 500=0.23836, 1000=0.21716, 2000=0.19913, 5000=0.17939 (USD); Forward Current: 1A; Reverse Voltage: 600V; Height: 1.1mm; ComponentLink1URL: http://www.farnell.com/datasheets/2572314.pdf?src-supplier=Farnell; ComponentLink1Description: http://www.farnell.com/datasheets/2572314.pdf?src-supplier=Farnell; ComponentLink2URL: http://www.farnell.com/datasheets/2572314.pdf?src-supplier=Newark; ComponentLink2Description: http://www.farnell.com/datasheets/2572314.pdf?src-supplier=Newark; ComponentLink3URL: http://www.farnell.com/datasheets/2572314.pdf?src-supplier=Element14; ComponentLink3Description: http://www.farnell.com/datasheets/2572314.pdf?src-supplier=Element14; ComponentLink4URL: https://www.onsemi.com/pub/Collateral/ES1JAF-D.PDF?src-supplier=Digikey; ComponentLink4Description: https://www.onsemi.com/pub/Collateral/ES1JAF-D.PDF?src-supplier=Digikey; ComponentLink5URL: https://www.fairchildsemi.com/datasheets/ES/ES1DAF.pdf?src-supplier=Digikey; ComponentLink5Description: https://www.fairchildsemi.com/datasheets/ES/ES1DAF.pdf?src-supplier=Digikey
D52 = 1N4148W-7-F: DIODE GEN PURP 100V 300MA SOD123; Manufacturer: Diodes; Forward Current: 150mA; Reverse Recovery Time: 4ns; Max Forward Surge Current (Ifsm): 2A; Element Configuration: Single; Max Reverse Current: 1uA; Forward Voltage: 1.25V; Power Dissipation: 400mW; Polarity: Standard; Voltage Rating (DC): 75V; Value: 2pF; Supplier 1: Future Electronics; Manufacturer Part Number: 1N4148W-7-F; RoHS: Yes; Category: Rectifier Diodes; Stock 1: 32931000; Pricing 1: 3000=0.01840, 12000=0.01760, 45000=0.01690, 120000=0.01640, 300000=0.01560 (USD); Mounting Technology: Surface Mount; Pins: 2; Weight: 0.000353oz; Contact Plating: Tin,Matte; Min Operating Temperature: -65°C; Max Operating Temperature: 150°C; Packaging: Tape and Reel; Max Repetitive Reverse Voltage (Vrrm): 100V; Peak Non-Repetitive Surge Current: 2A; Voltage: 100V; Max Surge Current: 2A; Package Quantity: 3000; Recovery Time: 4ns; Average Rectified Current: 300mA; Power Rating: 400mW; Current Rating: 150mA; Output Current: 150mA; Max Reverse Voltage (DC): 100V; Series: -; Reverse Recovery Time-Max: 4ns; Length: 2.85mm; Width: 1.7mm; Height: 1.25mm; Radiation Hardening: No; RoHS Compliant: Yes; Reach SVHC Compliant: Yes; Lead Free: Lead Free; ComponentLink1URL: https://datasheet.ciiva.com/1179/1915529-1179304.pdf?src-supplier=Element14; ComponentLink1Description: https://datasheet.ciiva.com/1179/1915529-1179304.pdf?src-supplier=Element14; ComponentLink2URL: https://datasheet.ciiva.com/22695/1915529-22695239.pdf?src-supplier=Element14; ComponentLink2Description: https://datasheet.ciiva.com/22695/1915529-22695239.pdf?src-supplier=Element14; ComponentLink3URL: https://datasheet.ciiva.com/8300/ds30086-8300392.pdf?src-supplier=Avnet; ComponentLink3Description: https://datasheet.ciiva.com/8300/ds30086-8300392.pdf?src-supplier=Avnet; ComponentLink4URL: https://datasheet.ciiva.com/15219/getdatasheetpartid-110030-15219548.pdf?src-supplier=Verical; ComponentLink4Description: https://datasheet.ciiva.com/15219/getdatasheetpartid-110030-15219548.pdf?src-supplier=Verical; ComponentLink5URL: https://datasheet.ciiva.com/8303/ds30086-8303197.pdf?src-supplier=Avnet; ComponentLink5Description: https://datasheet.ciiva.com/8303/ds30086-8303197.pdf?src-supplier=Avnet; ComponentLink6URL: https://datasheet.ciiva.com/911/ds30086-911735.pdf?src-supplier=Digi-Key; ComponentLink6Description: https://datasheet.ciiva.com/911/ds30086-911735.pdf?src-supplier=Digi-Key; ComponentLink7URL: https://datasheet.ciiva.com/911/ds30086-911736.pdf?src-supplier=Digi-Key; ComponentLink7Description: https://datasheet.ciiva.com/911/ds30086-911736.pdf?src-supplier=Digi-Key; ComponentLink8URL: https://datasheet.ciiva.com/911/ds30086-911734.pdf?src-supplier=Digi-Key; ComponentLink8Description: https://datasheet.ciiva.com/911/ds30086-911734.pdf?src-supplier=Digi-Key; ComponentLink9URL: https://datasheet.ciiva.com/4435/ds30086-4435128.pdf?src-supplier=Mouser; ComponentLink9Description: https://datasheet.ciiva.com/4435/ds30086-4435128.pdf?src-supplier=Mouser; Supplier Part Number 1: 7634694; LCSC Part Number: C83528; Item Type: Diode
NT4 = Net Tie_SMD: Net Tie SMD; Manufacturer Part Number: Net Tie; Item Type: Net Tie Pad
Q26 Q28 = CSD19502Q5B: MOSFET N-CH 80V 100A 8VSON; Manufacturer: Texas Instruments; Manufacturer Part Number: CSD19502Q5B; Package: 8-VSON-CLIP (5x6); LCSC Part Number: C2864118; Item Type: Mosfet; ComponentLink1Description: LCSC; ComponentLink1URL: https://jlcpcb.com/partdetail/TexasInstruments-CSD19502Q5B/C2864118
Q27 = FZT651TA: TRANS NPN 60V 3A SOT223-3; Manufacturer: Diodes Zetex; Item Type: BJTs; Max Power Dissipation: 2W; Number of Elements: 1; Frequency: 175MHz; hFE Min: 100; Collector Base Voltage (VCBO): 80V; Emitter Base Voltage (VEBO): 5V; Collector Emitter Saturation Voltage: 430mV; Collector-emitter Voltage-Max: 600mV; Supplier: Future Electronics; LCSC Part Number: C24098; Manufacturer Part Number: FZT651TA; RoHS: Yes; Stock: 670000; Pricing: 1000=0.265, 3000=0.255, 4000=0.25, 10000=0.245, 15000=0.24 (USD); Mounting Technology: Surface Mount; Case/Package: SOT-223; Pins: 4; Weight: 0.000282oz; Min Operating Temperature: -55°C; Max Operating Temperature: 150°C; Packaging: Tape and Reel; Package Quantity: 1; Collector Emitter Voltage (VCEO): 60V; Max Collector Current: 3A; Transition Frequency: 175MHz; Polarity: NPN; Continuous Collector Current: 3A; Collector Emitter Breakdown Voltage: 60V; Max Breakdown Voltage: 60V; Clock Frequency: 175MHz; Power Dissipation: 2W; Termination: SMD/SMT; Gain Bandwidth Product: 175MHz; Voltage Rating (DC): 60V; Current Rating: 3A; Current: 3A; Voltage: 60V; Series: -; Length: 6.7mm; Width: 3.7mm; Height: 1.65mm; Radiation Hardening: No; Reach SVHC Compliant: No; Lead Free: Lead Free; RoHS Compliant: Yes; ComponentLink1URL: https://datasheet.ciiva.com/5782/73067-5782650.pdf?src-supplier=Farnell; ComponentLink1Description: https://datasheet.ciiva.com/5782/73067-5782650.pdf?src-supplier=Farnell; ComponentLink2URL: https://datasheet.ciiva.com/8029/73067-8029643.pdf?src-supplier=Element14; ComponentLink2Description: https://datasheet.ciiva.com/8029/73067-8029643.pdf?src-supplier=Element14; ComponentLink3URL: https://datasheet.ciiva.com/4723/fzt651-4723319.pdf?src-supplier=Mouser; ComponentLink3Description: https://datasheet.ciiva.com/4723/fzt651-4723319.pdf?src-supplier=Mouser; ComponentLink4URL: https://datasheet.ciiva.com/975/fzt651-975544.pdf?src-supplier=Digikey; ComponentLink4Description: https://datasheet.ciiva.com/975/fzt651-975544.pdf?src-supplier=Digikey
R195 R200 = CRCW060310R0FKEA: RES SMD 10 OHM 1% 1/10W 0603; Manufacturer: Vishay; Item Type: Resistors; Power Rating: 100mW; Voltage Rating: 75V; Temperature Coefficient: 100ppm/°C; Supplier: Mouser; LCSC Part Number: C844919; Manufacturer Part Number: CRCW060310R0FKEA; RoHS: Yes; Stock: 648208; Pricing: 1=0.1, 10=0.017, 50=0.017, 100=0.01, 1000=0.008, 10000=0.005 (USD); Case/Package: 0603; Pins: 2; Weight: 7.1E-05oz; Case Code (Metric): 1608; Case Code (Imperial): 0603; Contact Plating: Tin; Min Operating Temperature: -55°C; Max Operating Temperature: 155°C; Value: 10R; Tolerance: 1%; Resistor Type: Thick Film; Packaging: Tape and Reel; Package Quantity: 10; Number of Terminations: 2; Termination: SMD/SMT; Max Power Dissipation: 100mW; Features: Automotive AEC-Q200; Series: CRCW; Resistance Tolerance: 1%; Technology: THICK FILM; Voltage Rating (DC): 75V; Construction: Rectangular; Length: 1.55mm; Width: 0.033inch; Height: 0.45mm; Depth: 0.85mm; RoHS Compliant: Yes; Reach SVHC Compliant: Unknown; Lead Free: 5697LeadFree; Military Standard: Not; ComponentLink1URL: https://datasheet.ciiva.com/11808/0900766b80d98afc-11808660.pdf?src-supplier=Rs; ComponentLink1Description: https://datasheet.ciiva.com/11808/0900766b80d98afc-11808660.pdf?src-supplier=Rs; ComponentLink2URL: https://datasheet.ciiva.com/26316/fld-crcw-e3-data-en-26316582.pdf?src-supplier=Distrelec; ComponentLink2Description: https://datasheet.ciiva.com/26316/fld-crcw-e3-data-en-26316582.pdf?src-supplier=Distrelec; ComponentLink3URL: https://datasheet.ciiva.com/2465/dcrcwe3-2465700.pdf?src-supplier=Digikey; ComponentLink3Description: https://datasheet.ciiva.com/2465/dcrcwe3-2465700.pdf?src-supplier=Digikey; ComponentLink4URL: https://datasheet.ciiva.com/16781/70201119-16781847.pdf?src-supplier=Allied+Electronics; ComponentLink4Description: https://datasheet.ciiva.com/16781/70201119-16781847.pdf?src-supplier=Allied+Electronics; ComponentLink5URL: https://datasheet.ciiva.com/22673/1697337-22673071.pdf?src-supplier=Element14; ComponentLink5Description: https://datasheet.ciiva.com/22673/1697337-22673071.pdf?src-supplier=Element14; ComponentLink6URL: https://datasheet.ciiva.com/2465/dcrcwe3-2465701.pdf?src-supplier=Digikey; ComponentLink6Description: https://datasheet.ciiva.com/2465/dcrcwe3-2465701.pdf?src-supplier=Digikey; ComponentLink7URL: https://datasheet.ciiva.com/2465/dcrcwe3-2465699.pdf?src-supplier=Digikey; ComponentLink7Description: https://datasheet.ciiva.com/2465/dcrcwe3-2465699.pdf?src-supplier=Digikey; ComponentLink8URL: https://datasheet.ciiva.com/5547/dcrcwe3-109170-5547342.pdf?src-supplier=Mouser; ComponentLink8Description: https://datasheet.ciiva.com/5547/dcrcwe3-109170-5547342.pdf?src-supplier=Mouser
R196 R201 = RC0805FR-7W10KL: RES 10K OHM 1% 1/4W 0805; Manufacturer: Yageo; Item Type: Resistor; Supplier: Avnet; Supplier Part Number: 49AK3472; Manufacturer Part Number: RC0805FR-7W10KL; RoHS: Yes; Category: Chip SMD Resistors; Stock: 5000; Pricing: 1=0.153, 25=0.038, 50=0.03, 100=0.02 (USD); LCSC Part Number: C723404
R197 = CRCW12060000Z0EA: RES SMD 0 OHM JUMPER 1/4W 1206; Manufacturer: Vishay; Item Type: Resistor; Value: 0mR; Power Rating: 250mW; Voltage Rating: 200V; Temperature Coefficient: 100ppm/°C; Tolerance: 1%; Supplier: Mouser; LCSC Part Number: C190124; Manufacturer Part Number: CRCW12060000Z0EA; RoHS: Yes; Stock: 852938; Pricing: 1=0.1, 10=0.039, 50=0.039, 100=0.018, 1000=0.013, 10000=0.007 (USD); Case/Package: 1206; Weight: 0.000353oz; Case Code (Imperial): 1206; Case Code (Metric): 3216; Contact Plating: Tin; Min Operating Temperature: -55°C; Max Operating Temperature: 155°C; Resistor Type: Thick Film; Packaging: Tape and Reel; Package Quantity: 5000; Termination: SMD/SMT; Features: Automotive AEC-Q200; Series: CRCW; Max Power Dissipation: 250mW; Number of Terminations: 2; Technology: THICK FILM; Voltage Rating (DC): 200V; Construction: Rectangular; Length: 3.2mm; Width: 1.6mm; Height: 0.55mm; Depth: 1.6mm; Ratings: AEC-Q200; Radiation Hardening: No; RoHS Compliant: Yes; Lead Free: 5697LeadFree; Military Standard: Not; Reach SVHC Compliant: Unknown; ComponentLink1URL: https://datasheet.ciiva.com/7841/1720486-7841862.pdf?src-supplier=Element14; ComponentLink1Description: https://datasheet.ciiva.com/7841/1720486-7841862.pdf?src-supplier=Element14
R198 = CRGH0603F26K1: RES SMD 26.1K OHM 1% 1/5W 0603; Manufacturer: TE Connectivity; Item Type: Resistor; Value: 26.1kR; Temperature Coefficient: 100ppm/°C; Max Power Dissipation: 200mW; Voltage Rating: 50V; Number of Resistors: 1; Supplier: Digikey; LCSC Part Number: C4086912; Manufacturer Part Number: CRGH0603F26K1; RoHS: Yes; Pricing: 20000=0.00865 (USD); Mounting Technology: Surface Mount; Case/Package: 0603; Case Code (Imperial): 0603; Case Code (Metric): 1608; Min Operating Temperature: -55°C; Max Operating Temperature: 155°C; Tolerance: 1%; Packaging: Tape and Reel; Number of Terminations: 2; Series: CRGH, Neohm; Power Rating: 200mW; Resistor Type: Thick Film,Power resistor; Termination: Solder; Length: 1.6mm; Width: 0.8mm; Height: 0.45mm; RoHS Compliant: Yes; ELV: Compliant; ComponentLink1URL: http://www.mouser.com/ds/2/418/NG_DS_1773204-1_C-717624.pdf?src-supplier=Mouser; ComponentLink1Description: http://www.mouser.com/ds/2/418/NG_DS_1773204-1_C-717624.pdf?src-supplier=Mouser; ComponentLink2URL: https://www.te.com/commerce/DocumentDelivery/DDEController?Action=srchrtrv&amp;DocNm=1773204-1&amp;DocType=DS&amp;DocLang=English&src-supplier=Digikey; ComponentLink2Description: https://www.te.com/commerce/DocumentDelivery/DDEController?Action=srchrtrv&amp;DocNm=1773204-1&amp;DocType=DS&amp;DocLang=English&src-supplier=Digikey
R199 = CRCW06037K15FKEA: RES SMD 7.15K OHM 1% 1/10W 0603; Manufacturer: Vishay; Item Type: Resistor; Supplier: Mouser; LCSC Part Number: C844382; Manufacturer Part Number: CRCW06037K15FKEA; RoHS: Yes; Stock: 18619; Pricing: 1=0.1, 10=0.019, 50=0.019, 100=0.009, 1000=0.007, 10000=0.004 (USD); Lead Free: 5697LeadFree; ComponentLink1URL: https://datasheet.ciiva.com/11810/0900766b80d98afc-11810198.pdf?src-supplier=Rs; ComponentLink1Description: https://datasheet.ciiva.com/11810/0900766b80d98afc-11810198.pdf?src-supplier=Rs; ComponentLink2URL: https://datasheet.ciiva.com/22707/1697337-22707757.pdf?src-supplier=Element14; ComponentLink2Description: https://datasheet.ciiva.com/22707/1697337-22707757.pdf?src-supplier=Element14; ComponentLink3URL: https://datasheet.ciiva.com/7679/1697337-7679142.pdf?src-supplier=Element14; ComponentLink3Description: https://datasheet.ciiva.com/7679/1697337-7679142.pdf?src-supplier=Element14; ComponentLink4URL: https://datasheet.ciiva.com/7679/1697337-7679143.pdf?src-supplier=Element14; ComponentLink4Description: https://datasheet.ciiva.com/7679/1697337-7679143.pdf?src-supplier=Element14; ComponentLink5URL: https://datasheet.ciiva.com/16397/dcrcwe3-16397317.pdf?src-supplier=Future+Electronics; ComponentLink5Description: https://datasheet.ciiva.com/16397/dcrcwe3-16397317.pdf?src-supplier=Future+Electronics; ComponentLink6URL: https://datasheet.ciiva.com/2466/dcrcwe3-2466245.pdf?src-supplier=Digikey; ComponentLink6Description: https://datasheet.ciiva.com/2466/dcrcwe3-2466245.pdf?src-supplier=Digikey; ComponentLink7URL: https://datasheet.ciiva.com/2466/dcrcwe3-2466246.pdf?src-supplier=Digikey; ComponentLink7Description: https://datasheet.ciiva.com/2466/dcrcwe3-2466246.pdf?src-supplier=Digikey; ComponentLink8URL: https://datasheet.ciiva.com/2466/dcrcwe3-2466247.pdf?src-supplier=Digikey; ComponentLink8Description: https://datasheet.ciiva.com/2466/dcrcwe3-2466247.pdf?src-supplier=Digikey; ComponentLink9URL: https://datasheet.ciiva.com/3257/dcrcwe3-3257899.pdf?src-supplier=Avnet; ComponentLink9Description: https://datasheet.ciiva.com/3257/dcrcwe3-3257899.pdf?src-supplier=Avnet
R202 = CRCW08055K60FKEA: RES SMD 5.6K OHM 1% 1/8W 0805; Manufacturer: Vishay; Value: 5.6kR; Max Power Dissipation: 125mW; Temperature Coefficient: 100ppm/°C; Voltage Rating: 150V; Item Type: Resistor; Supplier: Rs; Supplier Part Number: 6791572P; Manufacturer Part Number: CRCW08055K60FKEA; RoHS: Yes; Category: Chip SMD Resistors; Stock: 100250; Pricing: 1250=0.024, 2500=0.013, 4000=0.015, 5000=0.011 (GBP); Case/Package: 0805; Pins: 2; Weight: 0.000194oz; Case Code (Imperial): 0805; Case Code (Metric): 2012; Contact Plating: Tin; Min Operating Temperature: -55°C; Max Operating Temperature: 155°C; Tolerance: 1%; Packaging: Tape and Reel; Number of Terminations: 2; Series: CRCW; Resistor Type: Thick Film; Package Quantity: 5000; Power Rating: 125mW; Termination: SMD/SMT; Voltage Rating (DC): 150V; Features: Automotive AEC-Q200; Technology: THICK FILM; Resistance Tolerance: 1%; Length: 2mm; Width: 1.25mm; Height: 0.45mm; Depth: 1.25mm; Ratings: AEC-Q200; RoHS Compliant: Yes; Reach SVHC Compliant: Unknown; ComponentLink1URL: https://datasheet.ciiva.com/11811/0900766b80d98b26-11811062.pdf?src-supplier=Rs; ComponentLink1Description: https://datasheet.ciiva.com/11811/0900766b80d98b26-11811062.pdf?src-supplier=Rs; ComponentLink2URL: https://datasheet.ciiva.com/2525/dcrcwe3-2525722.pdf?src-supplier=Digi-Key; ComponentLink2Description: https://datasheet.ciiva.com/2525/dcrcwe3-2525722.pdf?src-supplier=Digi-Key; ComponentLink3URL: https://datasheet.ciiva.com/16767/70201119-16767127.pdf?src-supplier=Allied+Electronics; ComponentLink3Description: https://datasheet.ciiva.com/16767/70201119-16767127.pdf?src-supplier=Allied+Electronics; ComponentLink4URL: https://datasheet.ciiva.com/7841/1697337-7841861.pdf?src-supplier=Element14; ComponentLink4Description: https://datasheet.ciiva.com/7841/1697337-7841861.pdf?src-supplier=Element14; ComponentLink5URL: https://datasheet.ciiva.com/26317/fld-crcw-e3-data-en-26317147.pdf?src-supplier=Distrelec; ComponentLink5Description: https://datasheet.ciiva.com/26317/fld-crcw-e3-data-en-26317147.pdf?src-supplier=Distrelec; ComponentLink6URL: https://datasheet.ciiva.com/7841/1697337-7841690.pdf?src-supplier=Element14; ComponentLink6Description: https://datasheet.ciiva.com/7841/1697337-7841690.pdf?src-supplier=Element14; ComponentLink7URL: https://datasheet.ciiva.com/22683/1847332-22683327.pdf?src-supplier=Element14; ComponentLink7Description: https://datasheet.ciiva.com/22683/1847332-22683327.pdf?src-supplier=Element14; ComponentLink8URL: https://datasheet.ciiva.com/2525/dcrcwe3-2525723.pdf?src-supplier=Digi-Key; ComponentLink8Description: https://datasheet.ciiva.com/2525/dcrcwe3-2525723.pdf?src-supplier=Digi-Key; ComponentLink9URL: https://datasheet.ciiva.com/2525/dcrcwe3-2525724.pdf?src-supplier=Digi-Key; ComponentLink9Description: https://datasheet.ciiva.com/2525/dcrcwe3-2525724.pdf?src-supplier=Digi-Key; ComponentLink10URL: https://datasheet.ciiva.com/9065/dcrcwe3-9065422.pdf?src-supplier=Avnet; ComponentLink10Description: https://datasheet.ciiva.com/9065/dcrcwe3-9065422.pdf?src-supplier=Avnet; LCSC Part Number: C844634
R203 = RK73G1JTTD1002F: RES 10K OHM 1% 1/10W 0603; Item Type: Resistor; Value: 10kR; Power Rating: 100mW; Voltage Rating: 75V; Temperature Coefficient: 50ppm/°C; LCSC Part Number: C362180; ComponentLink1Description: LCSC; Supplier: Digi-Key; Supplier Part Number: 2019-RK73G1JTTD1002FCT-ND; RoHS: Yes; Category: Chip SMD Resistors; Stock: 249394; Pricing: 1=0.22, 10=0.118, 50=0.0812, 100=0.0699, 500=0.0513, 1000=0.04545 (USD); Case/Package: 0603; Case Code (Imperial): 0603; Case Code (Metric): 1608; Min Operating Temperature: -55°C; Max Operating Temperature: 125°C; Tolerance: 1%; Packaging: Tape and Reel; Termination: SMD/SMT; Series: RK73G; Construction: Rectangular; Length: 1.6mm; Depth: 0.8mm; Military Standard: Not; RoHS Compliant: Yes; ComponentLink2URL: http://www.mouser.com/ds/2/219/RK73G-9863.pdf?src-supplier=Mouser; ComponentLink2Description: http://www.mouser.com/ds/2/219/RK73G-9863.pdf?src-supplier=Mouser
R204 = CR0603-FX-4991ELF: RES SMD 4.99K OHM 1% 1/10W 0603; Manufacturer: Bourns; Item Type: Resistor; Voltage Rating (DC): 50V; Supplier: Digikey; LCSC Part Number: C203645; Manufacturer Part Number: CR0603-FX-4991ELF; RoHS: Yes; Stock: 84955; Pricing: 1=0.1, 10=0.014, 25=0.0108, 50=0.008, 100=0.0057, 250=0.00456, 500=0.00364, 1000=0.00268 (USD); Thickness: 457um; RoHS Compliant: 5897YesNo; ComponentLink1URL: https://datasheet.ciiva.com/9122/chpreztr-9122757.pdf?src-supplier=Avnet; ComponentLink1Description: https://datasheet.ciiva.com/9122/chpreztr-9122757.pdf?src-supplier=Avnet; ComponentLink2URL: https://datasheet.ciiva.com/6547/chpreztr-6547333.pdf?src-supplier=Digikey; ComponentLink2Description: https://datasheet.ciiva.com/6547/chpreztr-6547333.pdf?src-supplier=Digikey; ComponentLink3URL: https://datasheet.ciiva.com/6547/chpreztr-6547335.pdf?src-supplier=Digikey; ComponentLink3Description: https://datasheet.ciiva.com/6547/chpreztr-6547335.pdf?src-supplier=Digikey